# Altium schematic sheet Mux_Sheet _3.SchDoc
size A4
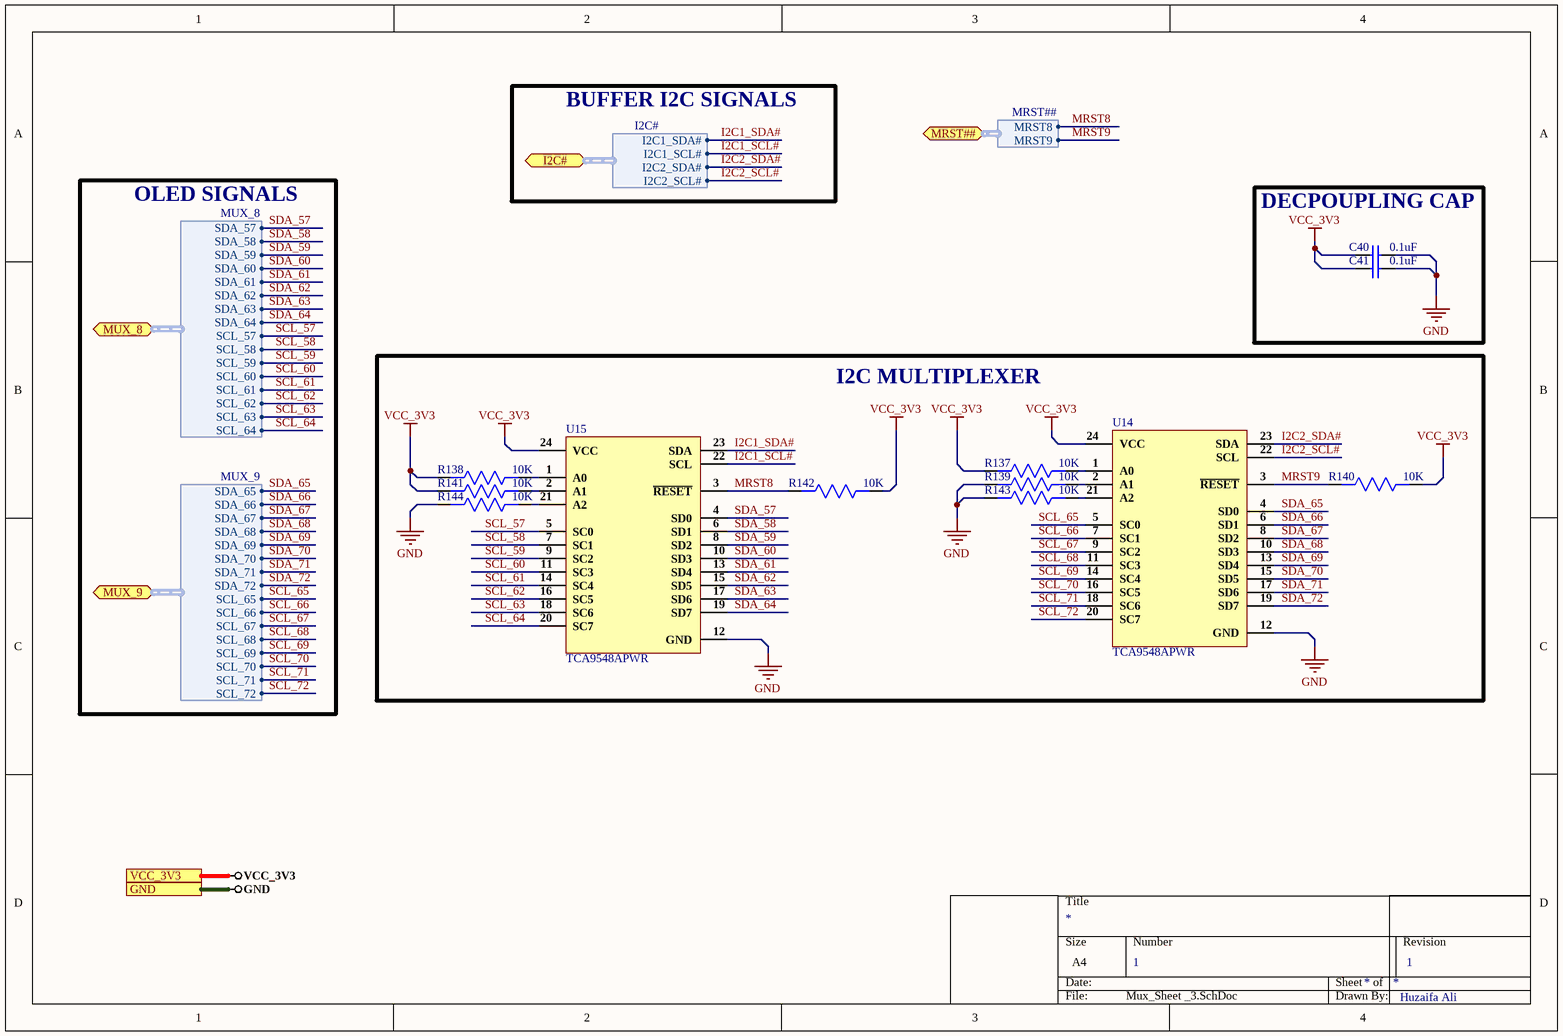
[diagram p0: Mux_Sheet _3.SchDoc]

## Parts
C40  0.1uF  [Cap0603]
C41  0.1uF  [Cap0603]
R137  10K  [Res0603]
R138  10K  [Res0603]
R139  10K  [Res0603]
R140  10K  [Res0603]
R141  10K  [Res0603]
R142  10K  [Res0603]
R143  10K  [Res0603]
R144  10K  [Res0603]
U14  TCA9548APWR  [24-TSSOP]
U15  TCA9548APWR  [24-TSSOP]

## Blocks framed on the sheet
DECPOUPLING CAP: C40 C41
I2C MULTIPLEXER: R137-R144 U14 U15

## Ports
GND, I2C# (bidir, harness I2C#), MRST## (bidir, harness MRST##), MUX_8 (bidir, harness MUX_8), MUX_9 (bidir, harness MUX_9), VCC_3V3

## Harnesses
I2C#: I2C1_SDA#, I2C1_SCL#, I2C2_SDA#, I2C2_SCL#
MUX_8: SDA_57, SDA_58, SDA_59, SDA_60, SDA_61, SDA_62, SDA_63, SDA_64, SCL_57, SCL_58, SCL_59, SCL_60, SCL_61, SCL_62, SCL_63, SCL_64
MUX_9: SDA_65, SDA_66, SDA_67, SDA_68, SDA_69, SDA_70, SDA_71, SDA_72, SCL_65, SCL_66, SCL_67, SCL_68, SCL_69, SCL_70, SCL_71, SCL_72
MRST##: MRST8, MRST9

## Nets
GND: C40.2 C41.2 R139.2 R143.2 R144.2 U14.12(GND) U15.12(GND) ; port GND
VCC_3V3: C40.1 C41.1 R137.2 R138.2 R140.1 R141.2 R142.1 U14.24(VCC) U15.24(VCC) ; port VCC_3V3
I2C1_SCL#: U15.22(SCL) ; port I2C#.I2C1_SCL#
I2C1_SDA#: U15.23(SDA) ; port I2C#.I2C1_SDA#
I2C2_SCL#: U14.22(SCL) ; port I2C#.I2C2_SCL#
I2C2_SDA#: U14.23(SDA) ; port I2C#.I2C2_SDA#
MRST8: R142.2 U15.3(~{RESET}) ; port MRST##.MRST8
MRST9: R140.2 U14.3(~{RESET}) ; port MRST##.MRST9
SCL_57: U15.5(SC0) ; port MUX_8.SCL_57
SCL_58: U15.7(SC1) ; port MUX_8.SCL_58
SCL_59: U15.9(SC2) ; port MUX_8.SCL_59
SCL_60: U15.11(SC3) ; port MUX_8.SCL_60
SCL_61: U15.14(SC4) ; port MUX_8.SCL_61
SCL_62: U15.16(SC5) ; port MUX_8.SCL_62
SCL_63: U15.18(SC6) ; port MUX_8.SCL_63
SCL_64: U15.20(SC7) ; port MUX_8.SCL_64
SCL_65: U14.5(SC0) ; port MUX_9.SCL_65
SCL_66: U14.7(SC1) ; port MUX_9.SCL_66
SCL_67: U14.9(SC2) ; port MUX_9.SCL_67
SCL_68: U14.11(SC3) ; port MUX_9.SCL_68
SCL_69: U14.14(SC4) ; port MUX_9.SCL_69
SCL_70: U14.16(SC5) ; port MUX_9.SCL_70
SCL_71: U14.18(SC6) ; port MUX_9.SCL_71
SCL_72: U14.20(SC7) ; port MUX_9.SCL_72
SDA_57: U15.4(SD0) ; port MUX_8.SDA_57
SDA_58: U15.6(SD1) ; port MUX_8.SDA_58
SDA_59: U15.8(SD2) ; port MUX_8.SDA_59
SDA_60: U15.10(SD3) ; port MUX_8.SDA_60
SDA_61: U15.13(SD4) ; port MUX_8.SDA_61
SDA_62: U15.15(SD5) ; port MUX_8.SDA_62
SDA_63: U15.17(SD6) ; port MUX_8.SDA_63
SDA_64: U15.19(SD7) ; port MUX_8.SDA_64
SDA_65: U14.4(SD0) ; port MUX_9.SDA_65
SDA_66: U14.6(SD1) ; port MUX_9.SDA_66
SDA_67: U14.8(SD2) ; port MUX_9.SDA_67
SDA_68: U14.10(SD3) ; port MUX_9.SDA_68
SDA_69: U14.13(SD4) ; port MUX_9.SDA_69
SDA_70: U14.15(SD5) ; port MUX_9.SDA_70
SDA_71: U14.17(SD6) ; port MUX_9.SDA_71
SDA_72: U14.19(SD7) ; port MUX_9.SDA_72
NetR137_1: R137.1 U14.1(A0)
NetR138_1: R138.1 U15.1(A0)
NetR139_1: R139.1 U14.2(A1)
NetR141_1: R141.1 U15.2(A1)
NetR143_1: R143.1 U14.21(A2)
NetR144_1: R144.1 U15.21(A2)

## Notes on the sheet
- BUFFER I2C SIGNALS
- OLED SIGNALS
- 1
- Huzaifa Ali

## Library data of the parts
C40 C41 = CC0603ZRY5V9BB104: CAP CER 0.1UF 50V Y5V 0603; Manufacturer: Yageo; Capacitance: 100nF; Tolerance: 80%; Supplier 1: Digi-Key; Manufacturer Part Number: CC0603ZRY5V9BB104; Stock 1: 15000880; Pricing 1: 1=0.1, 10=0.075, 100=0.0334, 500=0.02386, 1000=0.01874 (USD); Mount: Surface Mount; Case/Package: 0603; Number of Pins: 2; Case Code (Metric): 1608; Case Code (Imperial): 0603; Min Operating Temperature: -30°C; Max Operating Temperature: 85°C; Dielectric: Y5V; Voltage Rating: 50V; Package Quantity: 1; Packaging: Tape and Reel; Voltage Rating (DC): 50V; Termination: SMD/SMT; Composition: Ceramic; Voltage: 50V; Length: 1.6mm; Height: 0.8mm; Width: 0.031inch; Thickness: 0.035inch; Depth: 0.8mm; Radiation Hardening: No; REACH SVHC: No SVHC; Lead Free: Lead Free; Halogen Free: Halogen Free; ComponentLink1URL: http://www.yageo.com/documents/recent/UPY-GPHC_Y5V_6.3V-to-50V_8.pdf?src-supplier=Digi-Key; ComponentLink1Description: http://www.yageo.com/documents/recent/UPY-GPHC_Y5V_6.3V-to-50V_8.pdf?src-supplier=Digi-Key; ComponentLink2URL: http://www.yageo.com/documents/recent/UPY-GPHC_Y5V_6.3V-to-50V_5.pdf?src-supplier=Avnet+Europe; ComponentLink2Description: http://www.yageo.com/documents/recent/UPY-GPHC_Y5V_6.3V-to-50V_5.pdf?src-supplier=Avnet+Europe; ComponentLink3URL: https://www.verical.com/server-webapp/html/getDatasheet?partID=403611&src-supplier=Verical; ComponentLink3Description: https://www.verical.com/server-webapp/html/getDatasheet?partID=403611&src-supplier=Verical; ComponentLink4URL: http://www.mouser.com/ds/2/447/Yageo_UPY-GP_NP0_16V-to-50V_9-358835.pdf?src-supplier=Mouser; ComponentLink4Description: http://www.mouser.com/ds/2/447/Yageo_UPY-GP_NP0_16V-to-50V_9-358835.pdf?src-supplier=Mouser; ComponentLink5URL: http://www.farnell.com/datasheets/1132289.pdf?src-supplier=Element14; ComponentLink5Description: http://www.farnell.com/datasheets/1132289.pdf?src-supplier=Element14; Supplier Part Number 1: 311-1343-1-ND
R137-R144 = AC0603JR-0710KL: RES SMD 10K OHM 5% 1/10W 0603; Manufacturer: Yageo; Voltage Rating: 50V; Resistance: 10kR; Power Rating: 100mW; Temperature Coefficient: 100ppm/°C; Supplier 1: Future Electronics; Manufacturer Part Number: AC0603JR-0710KL; RoHS: Yes; Category: Chip SMD Resistors; Stock 1: 1533000; Pricing 1: 5000=0.00540 (USD); Case/Package: 0603; Case Code (Imperial): 0603; Case Code (Metric): 1608; Size Code: 0603; Min Operating Temperature: -55°C; Max Operating Temperature: 155°C; Packaging: Tape and Reel; Tolerance: 5%; Package Quantity: 1; Resistor Type: Thick Film; Termination: SMD/SMT; Number of Terminations: 2; Max Power Dissipation: 100mW; Features: Moisture Resistant,Automotive AEC-Q200,Anti-Sulfur; Series: AC; Construction: Rectangular; Length: 0.063inch; Width: 0.031inch; Height: 0.022inch; Depth: 0.8mm; Military Standard: Not; Lead Free: Lead Free; RoHS Compliant: Yes; ComponentLink1URL: https://datasheet.ciiva.com/5562/pyu-ac-51-rohs-l-2-5562553.pdf?src-supplier=Mouser; ComponentLink1Description: https://datasheet.ciiva.com/5562/pyu-ac-51-rohs-l-2-5562553.pdf?src-supplier=Mouser; Supplier Part Number 1: 1029044
U14 U15 = TCA9548APWR: IC BUS SWITCH 1 X 8:1 24TSSOP; Manufacturer: Texas Instruments; Max Supply Voltage: 5.5V; Min Supply Voltage: 1.65V; On-State Resistance: 70R; Max Supply Current: 80uA; Supply Type: Single; Independent Circuits: 1; Supplier 1: Digi-Key; Manufacturer Part Number: TCA9548APWR; RoHS: Yes; Category: Decoders and Multiplexers; Pricing 1: 1=2.09000, 10=1.87600, 25=1.77040, 100=1.50820, 250=1.41616, 500=1.23914, 1000=1.16900 (USD); Mount: Surface Mount; Case/Package: TSSOP; Number of Pins: 24; Contact Plating: Gold; Min Operating Temperature: -40°C; Max Operating Temperature: 85°C; Packaging: Tape and Reel; Package Quantity: 1; REACH SVHC: No SVHC; Lead Free: Lead Free; ComponentLink1URL: https://datasheet.ciiva.com/6614/tca9548a-6614721.pdf?src-supplier=Digi-Key; ComponentLink1Description: https://datasheet.ciiva.com/6614/tca9548a-6614721.pdf?src-supplier=Digi-Key; Supplier Part Number 1: 296-34905-1-ND